# Altium schematic sheet Mixer.SchDoc
size A3; SheetNumber: 2; SheetTotal: 2; SPICEModelCacheLUFZZWDB: <root> / <DocumentId>LUFZZWDB</DocumentId> / </root>
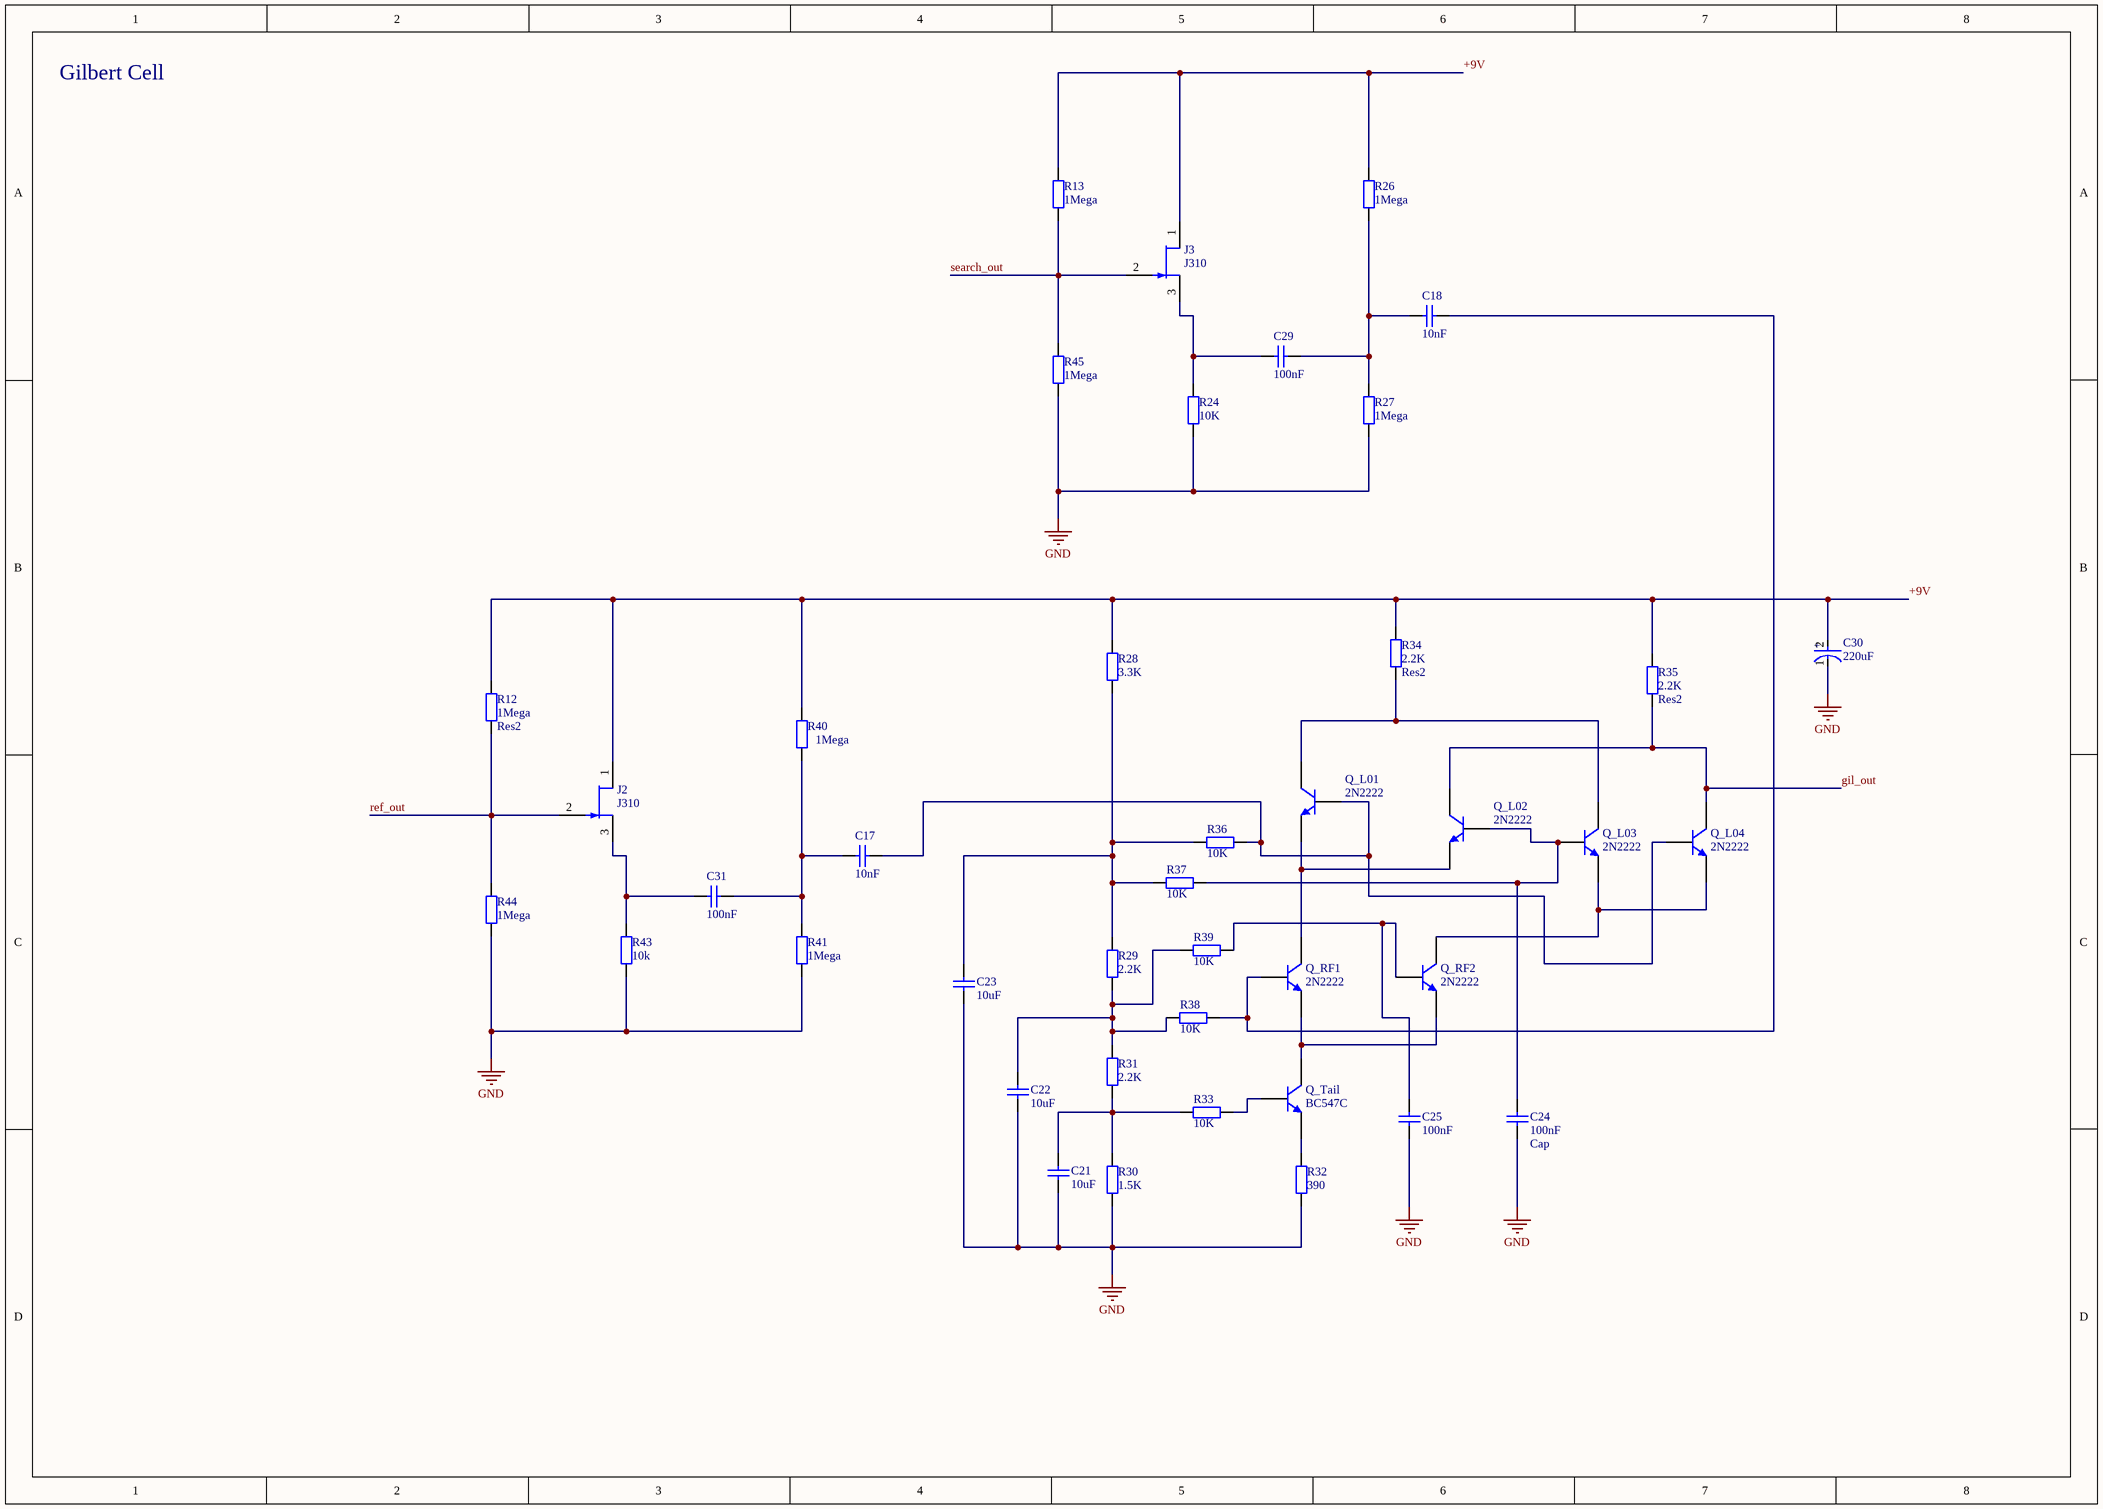
[diagram p0: Mixer.SchDoc]

## Parts
C17  value 10nF  [FP-RDE2M1-MFG]  (hidden comment: Cap)
C18  value 10nF  [FP-RDE2M1-MFG]  (hidden comment: Cap)
C21  value 10uF  [FP-RDE2M1-MFG]  (hidden comment: Cap)
C22  value 10uF  [FP-RDE2M1-MFG]  (hidden comment: Cap)
C23  value 10uF  [FP-RDE2M1-MFG]  (hidden comment: Cap)
C24  Cap  value 100nF  [FP-RDE2M1-MFG]
C25  value 100nF  [FP-RDE2M1-MFG]  (hidden comment: Cap)
C29  value 100nF  [FP-RDE2M1-MFG]  (hidden comment: Cap)
C30  220uF  [FP-RAD-TH-D_12_5_0_5-L_25-MFG]
C31  value 100nF  [FP-RDE2M1-MFG]  (hidden comment: Cap)
J2  J310  [TO-254-AA]
J3  J310  [TO-254-AA]
Q_L01  2N2222  [TO-226-AA]
Q_L02  2N2222  [TO-226-AA]
Q_L03  2N2222  [TO-226-AA]
Q_L04  2N2222  [TO-226-AA]
Q_RF1  2N2222  [TO-226-AA]
Q_RF2  2N2222  [TO-226-AA]
Q_Tail  BC547C  [TO-226-AA]
R12  Res2  value 1Mega  [FP-MRS25-MFG]
R13  value 1Mega  [FP-MRS25-MFG]  (hidden comment: Res2)
R24  value 10K  [FP-MRS25-MFG]  (hidden comment: Res2)
R26  value 1Mega  [FP-MRS25-MFG]  (hidden comment: Res2)
R27  value 1Mega  [FP-MRS25-MFG]  (hidden comment: Res2)
R28  value 3.3K  [FP-MRS25-MFG]  (hidden comment: Res2)
R29  value 2.2K  [FP-MRS25-MFG]  (hidden comment: Res2)
R30  value 1.5K  [FP-MRS25-MFG]  (hidden comment: Res2)
R31  value 2.2K  [FP-MRS25-MFG]  (hidden comment: Res2)
R32  value 390  [FP-MRS25-MFG]  (hidden comment: Res2)
R33  value 10K  [FP-MRS25-MFG]  (hidden comment: Res2)
R34  Res2  value 2.2K  [FP-MRS25-MFG]
R35  Res2  value 2.2K  [FP-MRS25-MFG]
R36  value 10K  [FP-MRS25-MFG]  (hidden comment: Res2)
R37  value 10K  [FP-MRS25-MFG]  (hidden comment: Res2)
R38  value 10K  [FP-MRS25-MFG]  (hidden comment: Res2)
R39  value 10K  [FP-MRS25-MFG]  (hidden comment: Res2)
R40  value 1Mega  [FP-MRS25-MFG]  (hidden comment: Res2)
R41  value 1Mega  [FP-MRS25-MFG]  (hidden comment: Res2)
R43  value 10k  [FP-MRS25-MFG]  (hidden comment: Res2)
R44  value 1Mega  [FP-MRS25-MFG]  (hidden comment: Res2)
R45  value 1Mega  [FP-MRS25-MFG]  (hidden comment: Res2)

## Nets
GND: C21.1 C22.1 C23.1 C24.1 C25.1 C30.1(C) R24.1 R27.1 R30.1 R32.1 R41.1 R43.1 R44.1 R45.1
+9V: C30.2(A) J2.1(D) J3.1(D) R12.2 R13.2 R26.2 R28.2 R34.2 R35.2 R40.2
gil_out: Q_L02.1(C) Q_L04.1(C) R35.1
ref_out: J2.2(G) R12.1 R44.2
search_out: J3.2(G) R13.1 R45.2
NetC17_1: C17.1 C31.2 R40.1 R41.2
NetC17_2: C17.2 Q_L01.2(B) Q_L04.2(B) R36.2
NetC18_1: C18.1 C29.2 R26.1 R27.2
NetC18_2: C18.2 Q_RF1.2(B) R38.2
NetC21_2: C21.2 R30.2 R31.1 R33.1
NetC22_2: C22.2 R29.1 R31.2 R38.1 R39.1
NetC23_2: C23.2 R28.1 R29.2 R36.1 R37.1
NetC24_2: C24.2 Q_L02.2(B) Q_L03.2(B) R37.2
NetC25_2: C25.2 Q_RF2.2(B) R39.2
NetC29_1: C29.1 J3.3(S) R24.2
NetC31_1: C31.1 J2.3(S) R43.2
NetQ_L01_1: Q_L01.1(C) Q_L03.1(C) R34.1
NetQ_L01_3: Q_L01.3(E) Q_L02.3(E) Q_RF1.1(C)
NetQ_L03_3: Q_L03.3(E) Q_L04.3(E) Q_RF2.1(C)
NetQ_RF1_3: Q_RF1.3(E) Q_RF2.3(E) Q_Tail.1(C)
NetQ_Tail_2: Q_Tail.2(B) R33.2
NetQ_Tail_3: Q_Tail.3(E) R32.2

## Notes on the sheet
- Gilbert Cell
- (in symbol CMP-05427-000330-1) +

## Library data of the parts
C17 C18 C21-C25 C29 C31 = Cap: Capacitor; Published: 8-Jun-2000; LatestRevisionDate: 17-Jul-2002; LatestRevisionNote: Re-released for DXP Platform.; PackageReference: RAD-0.3; Publisher: Altium Limited; PackageDescription: Radial Cap, Thru-Hole; 2 Leads; 0.3 in Pin Spacing
C30 = CMP-05427-000330-1: Aluminum Electrolytic Capacitors (Radial Lead Type) 220uF ±20% 100V; RoHS Compliant: Yes
J2 J3 = JFET-N: N-Channel JFET; pin to pad: 2>3 3>2; Published: 8-Jun-2000; LatestRevisionDate: 17-Jul-2002; LatestRevisionNote: Re-released for DXP Platform.; PackageReference: TO-254-AA; Publisher: Altium Limited; Code_JEDEC: TO-254-AA
Q_L01 Q_L02 Q_L03 Q_L04 Q_RF1 Q_RF2 Q_Tail = NPN: NPN Bipolar Transistor; Published: 8-Jun-2000; LatestRevisionDate: 17-Jul-2002; LatestRevisionNote: Re-released for DXP Platform.; PackageReference: TO-226-AA; Publisher: Altium Limited; PackageDescription: TO, Flat Index; 3 In-Line, Axial Leads; Body Dia. 4.8mm; Leads 0.55 x 0.51 mm (max); Code_JEDEC: TO-226-AA
R12 R13 R24 R26-R41 R43-R45 = Res2: Resistor; Published: 8-Jun-2000; LatestRevisionDate: 17-Jul-2002; LatestRevisionNote: Re-released for DXP Platform.; PackageReference: AXIAL-0.4; Publisher: Altium Limited; PackageDescription: Axial Device, Thru-Hole; 2 Leads; 0.4 in Pin Spacing